# Altium schematic sheet MCU_debug.SchDoc: =DT_SCH_Title
size A4; Organization: Droid Technologies; SheetNumber: 4; SheetTotal: 22
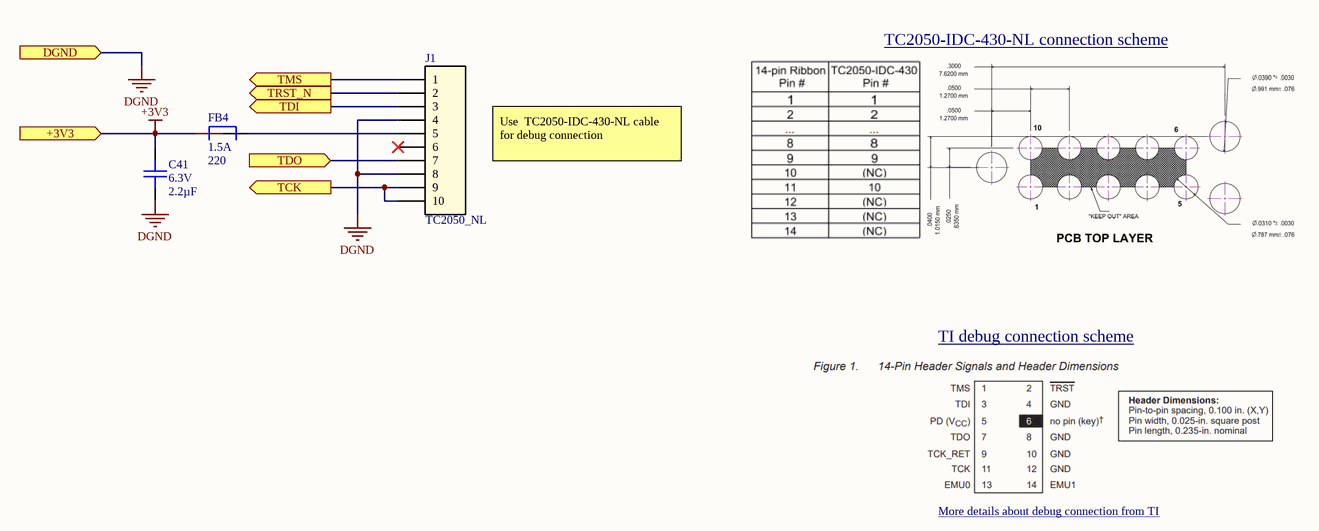
[diagram p0: MCU_debug.SchDoc]

## Parts
C41  Voltage Rating: 6.3V  Capacitance: 2.2µF  [CAPC160X80X90L35]  (hidden comment: C1608X8L0J225K080AC)
FB4  Imax: 1.5A  Impedance: 220  [BEADC160X80X95L40]  (hidden comment: BLM18KG221BH1D)
J1  TC2050_NL  [CONN__TAG_TC2050-IDC-NL]  (no BOM)

## Ports
+3V3 (in), DGND (in), TCK (out), TDI (out), TDO (in), TMS (out), TRST_N (out)

## Nets
+3V3: C41.2 FB4.1 ; port +3V3
DGND: C41.1 J1.4 J1.8 ; port DGND
TCK: J1.9 J1.10 ; port TCK
TDI: J1.3 ; port TDI
TDO: J1.7 ; port TDO
TMS: J1.1 ; port TMS
TRST_N: J1.2 ; port TRST_N
NetFB4_2: FB4.2 J1.5

Not connected (* = marked no-connect by the designer): J1 6*

## Notes on the sheet
- TC2050-IDC-430-NL connection scheme <https://www.tag-connect.com/wp-content/uploads/bsk-pdf-manager/TC2050-IDC-430-NL_Datasheet_9.pdf>
- Use  TC2050-IDC-430-NL cable for debug connection
- TI debug connection scheme <https://www.ti.com/lit/ug/spru641/spru641.pdf>
- More details about debug connection from TI <https://software-dl.ti.com/ccs/esd/documents/xdsdebugprobes/emu_jtag_connectors.html#connector-information>
- Title
- Size:
- A4
- Number:
- Revision:
- Date:
- Time:
- Sheet
- of

## Library data of the parts
C41 = CMP-001-2044-2: CAP CER 2.2UF 6.3V X8L 0603; Manufacturer: TDK Corporation; Op Temp min: -55°C; Tolerance: 10%; Op Temp max: 150°C; ComponentLink1URL: https://product.tdk.com/en/search/capacitor/ceramic/mlcc/info?part_no=C1608X8L0J225K080AC; MPN: C1608X8L0J225K080AC; ComponentLink3URL: https://www.digikey.com/en/products/detail/tdk-corporation/C1608X8L0J225K080AC/8343784; ComponentLink1Description: Datasheet; Lead Spacing: 0mm; ComponentLink3Description: Digikey; Package: 0603 (1608 Metric); Height max: 900µm; Size: 1.60mm x 0.80mm; Dielectric: X8L; Ratings: -; Mounting Type: SM; ComponentLink2URL: https://eu.mouser.com/ProductDetail/TDK/C1608X8L0J225K080AC?qs=rrS6PyfT74dgREMaiAoT3Q%3D%3D; ComponentLink2Description: Mouser
FB4 = CMP-001-1981-1: FERRITE BEAD 220 OHM 0603 1LN; Manufacturer: Murata Electronics; DCR: 50m; Op Temp min: -55°C; Frequency: 100MHz; Op Temp max: 150°C; Number of Lines: 1; Mounting Type: SM; Size: 1.60mm x 0.80mm; ComponentLink2URL: https://eu.mouser.com/ProductDetail/Murata-Electronics/BLM18KG221BH1D?qs=sJ5gq5MLFXpgEHYBdWUtkQ%3D%3D; ComponentLink1Description: Datasheet; ComponentLink1URL: https://www.murata.com/en-us/products/productdata/8798137286686/QNFA9129.pdf; Lead Spacing: 0mm; Ratings: AEC-Q200; ComponentLink3Description: Digikey; ComponentLink3URL: https://www.digikey.com/en/products/detail/murata-electronics/BLM18KG221BH1D/6156000; Height max: 950µm; Package: 0603 (1608 Metric); ComponentLink2Description: Mouser; MPN: BLM18KG221BH1D
J1 = CONN_TC2050_NL: PLUG-OF-NAILS 10-PIN W/O LEGS 8"; Manufacturer: Tag-Connect LLC; MPN: TC2050; Series: Plug-Of-Nails™; ComponentLink1Description: Datasheet; ComponentLink1URL: https://www.tag-connect.com/wp-content/uploads/bsk-pdf-manager/TC2050-IDC-NL_Datasheet_8.pdf; ComponentLink2Description: DigiKey; ComponentLink2URL: https://www.digikey.pl/en/products/detail/tag-connect-llc/TC2030-IDC/4571121